# Altium schematic sheet 52_BUCK_5V.SchDoc
size A4; SheetNumber: 12; SheetTotal: 16
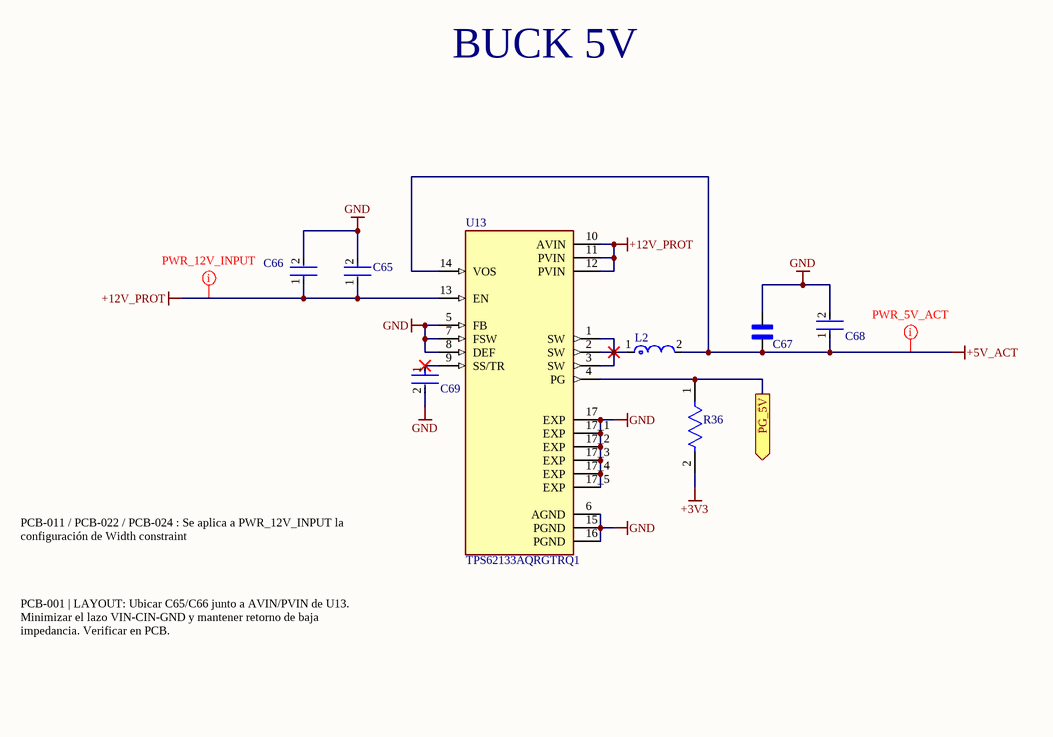
[diagram p0: 52_BUCK_5V.SchDoc]

## Parts
C65  GCM32ER71E106KA57K  [FP-GCM32E-0_3-IPC_B]  (value not drawn)
C66  C0603C104K3RACTU  [FP-C0603C-CF-IPC_B]  (value not drawn)
C67  C3225X7R1A226M230AC  [CAP_C3225X7R1A226M230AC]  (value not drawn)
C68  C0603C104K3RACTU  [FP-C0603C-CF-IPC_B]  (value not drawn)
C69  C0603C332J5GACTU  [FP-C0603C-CF-IPC_B]  (value not drawn)
L2  XFL4020-222MEC  [FP-XFL4020-MFG]  (value not drawn)
R36  RC0603FR-07100KL  [FP-RC0603-0_55-MFG]  (value not drawn)
U13  TPS62133AQRGTRQ1  [QFN50P300X300X100-17N]

## Ports
PG_5V (out)

## Nets
+3V3: R36.2
+5V_ACT: C67.2 C68.1 L2.2 U13.14(VOS)
+12V_PROT: C65.1 C66.1 U13.10(AVIN) U13.11(PVIN) U13.12(PVIN) U13.13(EN)
GND: C65.2 C66.2 C67.1 C68.2 C69.2 U13.5(FB) U13.6(AGND) U13.7(FSW) U13.8(DEF) U13.15(PGND) U13.16(PGND) U13.17(EXP) U13.17_1(EXP) U13.17_2(EXP) U13.17_3(EXP) U13.17_4(EXP) U13.17_5(EXP)
PG_5V: R36.1 U13.4(PG) ; port PG_5V
NetC69_1: C69.1 U13.9(SS/TR)
NetL2_1: L2.1 U13.1(SW) U13.2(SW) U13.3(SW)

## Layout directives
net class PWR_12V_INPUT; rule Width Constraint [Pref Width = 78.74mil    Min Width = 59.055mil    Max Width = 118.11mil]: +12V_PROT
net class PWR_5V_ACT: +5V_ACT

## Notes on the sheet
- BUCK 5V
- PCB-011 / PCB-022 / PCB-024 : Se aplica a PWR_12V_INPUT la configuración de Width constraint
- PCB-001 | LAYOUT: Ubicar C65/C66 junto a AVIN/PVIN de U13. Minimizar el lazo VIN-CIN-GND y mantener retorno de baja impedancia. Verificar en PCB.

## Library data of the parts
C65 = CMP-2000-06320-2: Ceramic Capacitor for Automotive 10uF ±10% 25VDC X7R 1210 Embossed T/R; Voltage Rating (DC): 25V; Height: 2.5mm; Ratings: AEC-Q200; Termination: SMD/SMT; Case Code (Imperial): 1210; Packaging: Tape and Reel; Min Operating Temperature: -55°C; Radiation Hardening: No; Mount: Surface Mount; Depth: 2.5mm; Case Code (Metric): 3225; Length: 3.2mm; Tolerance: 10%; Package Quantity: 4000; Width: 0.098inch; Max Operating Temperature: 125°C; Thickness: 0.106inch; Case/Package: 1210; Capacitance: 10uF; Voltage Rating: 25V; Dielectric: X7R
C66 C68 = CMP-2006-03057-2: CAP CER 0.1UF 25V X7R 0603; Manufacturer: KEMET; Value: 0.10 μF; Material: Ceramic; Tolerance: 0.1; Temperature Coefficient: 30ppm/°C; Automotive Grade: Grade 1; Lead Free: Yes; Device Class L3: Ceramic Capacitors; Voltage Rating: 25 V; Manufacturer Part Number: C0603C104K3RACTU; Digikey Description: CAP CER 0.1UF 25V X7R 0603; Mouser Description: Multilayer Ceramic Capacitors MLCC - SMD/SMT 25volts 0.1uF X7R 10%; Package: C0603C-CF; Temperature Range Low: -55°C; Automotive: Yes; Device Class L2: Capacitors; Octopart: https://octopart.com/c0603c104k3ractu-kemet-127541; ComponentLink2Description: Datasheet; ComponentLink2URL: https://api.kemet.com/component-edge/download/datasheet/C0603C100J5GACAUTO.pdf; Temperature Range High: +125°C; RoHS: TRUE; Device Class L1: Passive Components; Category: Cap; Temperature: -55°C to +125°C; Capacitance: 0.10 μF; Height: 0.87mm; Temperature Characteristic: X7R
C67 = C3225X7R1A226M230AC: 22 ÂµF Â±20% 10V Ceramic Capacitor X7R 1210 (3225 Metric); MF: TDK; SnapEDA_Link: https://www.snapeda.com/parts/C3225X7R1A226M230AC/TDK/view-part/?ref=snap; Package: 3225-2 TDK; Value: *; MP: C3225X7R1A226M230AC; Check_prices: https://www.snapeda.com/parts/C3225X7R1A226M230AC/TDK/view-part/?ref=eda
C69 = CMP-2006-03334-2: CAP CER 3300PF 50V 5% NP0 0603; Manufacturer: KEMET; Value: 3,300 pF; Temperature Characteristic: C0G; Temperature Coefficient: 30ppm/°C; Tolerance: 0.05; Automotive Grade: Grade 1; Material: Ceramic; Category: Cap; Digikey Description: CAP CER 3300PF 50V 5% NP0 0603; Temperature Range Low: -55°C; Mouser Description: Multilayer Ceramic Capacitors MLCC - SMD/SMT 50volts 3300pF 5% C0G; Device Class L2: Capacitors; Octopart: https://octopart.com/c0603c332j5gactu-kemet-12580539; Package: C0603C-CF; Lead Free: Yes; Temperature Range High: +125°C; Automotive: Yes; ComponentLink2URL: https://api.kemet.com/component-edge/download/datasheet/C0603C100J5GACAUTO.pdf; Voltage Rating: 50 V; Device Class L3: Ceramic Capacitors; Temperature: -55°C to +125°C; ComponentLink2Description: Datasheet; Device Class L1: Passive Components; Manufacturer Part Number: C0603C332J5GACTU; Capacitance: 3,300 pF; Height: 0.87mm; RoHS: TRUE
L2 = CMP-2000-05090-4: INDUCTOR, 2.2UH, 8A, 20%, 38MHZ, REEL; Test Frequency: 100kHz; Shielding: Shielded; Saturation Current: 3.1A; DC Resistance (DCR): 23.5mR; Core Material: Composite; Height: 2.1mm; Width: 4.3mm; Mount: Surface Mount; RMS Current (Irms): 8A; Case/Package: SMD/SMT; Length: 4.3mm; REACH SVHC: No SVHC; Max DC Current: 8A; Min Operating Temperature: -40°C; Series: XFL4020; Self Resonant Frequency: 38MHz; Inductance Tolerance: 20%; Lead Free: Contains Lead; Tolerance: 20%; RoHS Compliant: Yes; Termination: SMD/SMT; Packaging: Tape and Reel; Max Operating Temperature: 125°C; Inductance: 2.2uH
R36 = CMP-2100-03662-2: RES SMD 100K OHM 1% 1/10W 0603; Voltage Rating (DC): 50V; Resistance: 100kR; Max Power Dissipation: 100mW; Temperature Coefficient: 100ppm/°C; Working Voltage: 75V; Length: 1.6mm; Lead Free: Lead Free; Number of Terminations: 2; Packaging: Tape and Reel; Voltage Rating: 50V; Termination: SMD/SMT; Width: 0.8mm; Resistor Type: Thick Film; Resistance Tolerance: 1%; Features: Moisture Resistant; Height: 0.45mm; Construction: Rectangular; Case/Package: 0603; Military Standard: Not; Case Code (Imperial): 0603; Series: RC; Technology: THICK FILM; Depth: 0.8mm; RoHS Compliant: Yes; REACH SVHC: No SVHC; Min Operating Temperature: -55°C; Case Code (Metric): 1608; Max Operating Temperature: 155°C; Power Rating: 100mW; Number of Pins: 2; Tolerance: 1%
U13 = TPS62133AQRGTRQ1: 3V - 17V 3A AUTOMOTIVE Step-Down Converter In 3X3 QFN Package; MF: Texas Instruments; SnapEDA_Link: https://www.snapeda.com/parts/TPS62133AQRGTRQ1/Texas+Instruments/view-part/?ref=snap; Package: VQFN-16 Texas Instruments; Value: *; MP: TPS62133AQRGTRQ1; Check_prices: https://www.snapeda.com/parts/TPS62133AQRGTRQ1/Texas+Instruments/view-part/?ref=eda